# Altium schematic sheet 2026-11-21_20-42-341.schdoc
size 308 x 133 mm; SheetNumber: 1; SheetTotal: 1
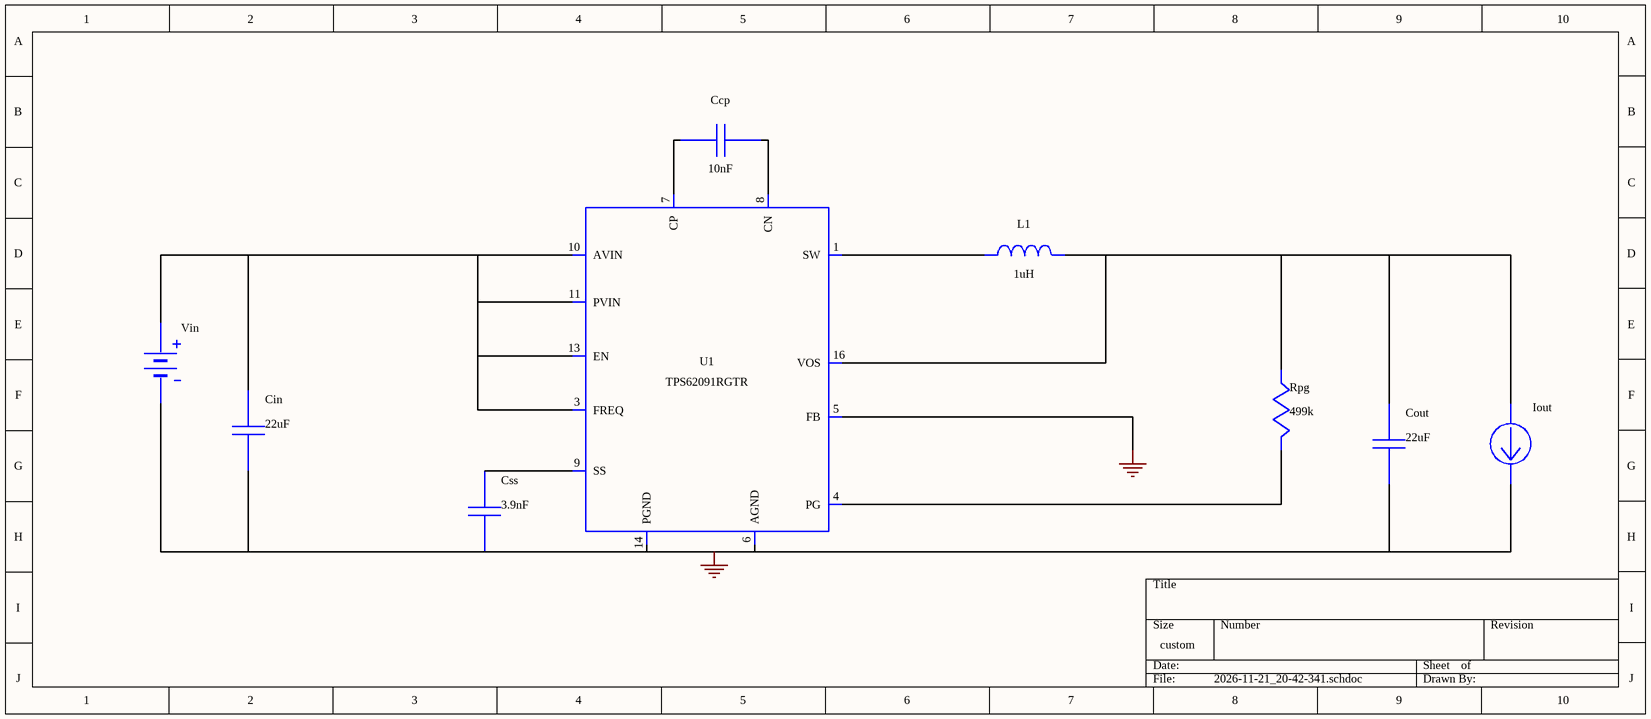
[diagram p0: 2026-11-21_20-42-341.schdoc]

## Parts
Ccp  value 10nF  (hidden comment: GRM155R71E103KA01D)
Cin  value 22uF  (hidden comment: GRM188R60J226MEA0D)
Cout  value 22uF  (hidden comment: GRM188R60J226MEA0D)
Css  value 3.9nF  (hidden comment: GRM033R71A392KA01D)
Iout  WB_CURRENT_LOAD  (value not drawn)
L1  value 1uH  (hidden comment: GENERIC_INDUCTOR)
Rpg  value 499k  (hidden comment: CRCW0402499KFKED)
U1  TPS62090RGTR  (value not drawn)
Vin  WB_BATTERY  (value not drawn)

## Nets
0: Cin.2 Cout.2 Css.2 Iout.2(-) U1.5(FB) U1.6(AGND) U1.14(PGND) U1.15(PGND) U1.17(ETPAD) Vin.2(-)
NetCcp_1: Ccp.1 U1.7(CP)
NetCcp_2: Ccp.2 U1.8(CN)
NetCin_1: Cin.1 U1.3(FREQ) U1.10(AVIN) U1.11(PVIN) U1.12(PVIN) U1.13(EN) Vin.1(+)
NetCout_1: Cout.1 Iout.1(+) L1.2 Rpg.2 U1.16(VOS)
NetCss_1: Css.1 U1.9(SS)
NetL1_1: L1.1 U1.1(SW) U1.2(SW)
NetRpg_1: Rpg.1 U1.4(PG)

## Library data of the parts
Ccp = GRM155R71E103KA01D: GRM155R71E103KA0; Manufacturer Name: MuRata; PackageReference: GRM155R71E103KA01D; Manufacturer Part Number: GRM155R71E103KA01D
Cin Cout = GRM188R60J226MEA0D: GRM188R60J226MEA; Manufacturer Name: MuRata; PackageReference: GRM188R60J226MEA0D; Manufacturer Part Number: GRM188R60J226MEA0D
Css = GRM033R71A392KA01D: GRM033R71A392KA0; Manufacturer Name: MuRata; PackageReference: GRM033R71A392KA01D; Manufacturer Part Number: GRM033R71A392KA01D
L1 = GENERIC_INDUCTOR: 74439346010; Manufacturer Name: Wurth Elektronik; PackageReference: 74439346010; Manufacturer Part Number: GENERIC_INDUCTOR
Rpg = CRCW0402499KFKED: Manufacturer Name: Vishay-Dale; PackageReference: CRCW0402499KFKED; Manufacturer Part Number: CRCW0402499KFKED
U1 = TPS62090RGTR: TPS62091RGTR; Manufacturer Name: Texas Instruments; PackageReference: TPS62091RGTR; Manufacturer Part Number: TPS62090RGTR; Value: N/A
Iout = WB_CURRENT_LOAD: PackageReference: WB_CURRENT_LOAD; Manufacturer Part Number: WB_CURRENT_LOAD; Manufacturer Name: WB_CURRENT_LOAD; Value: N/A
Vin = WB_BATTERY: PackageReference: WB_BATTERY; Manufacturer Part Number: WB_BATTERY; Manufacturer Name: WB_BATTERY; Value: N/A